# EAGLE design encoder-tester (EAGLE 6.1)
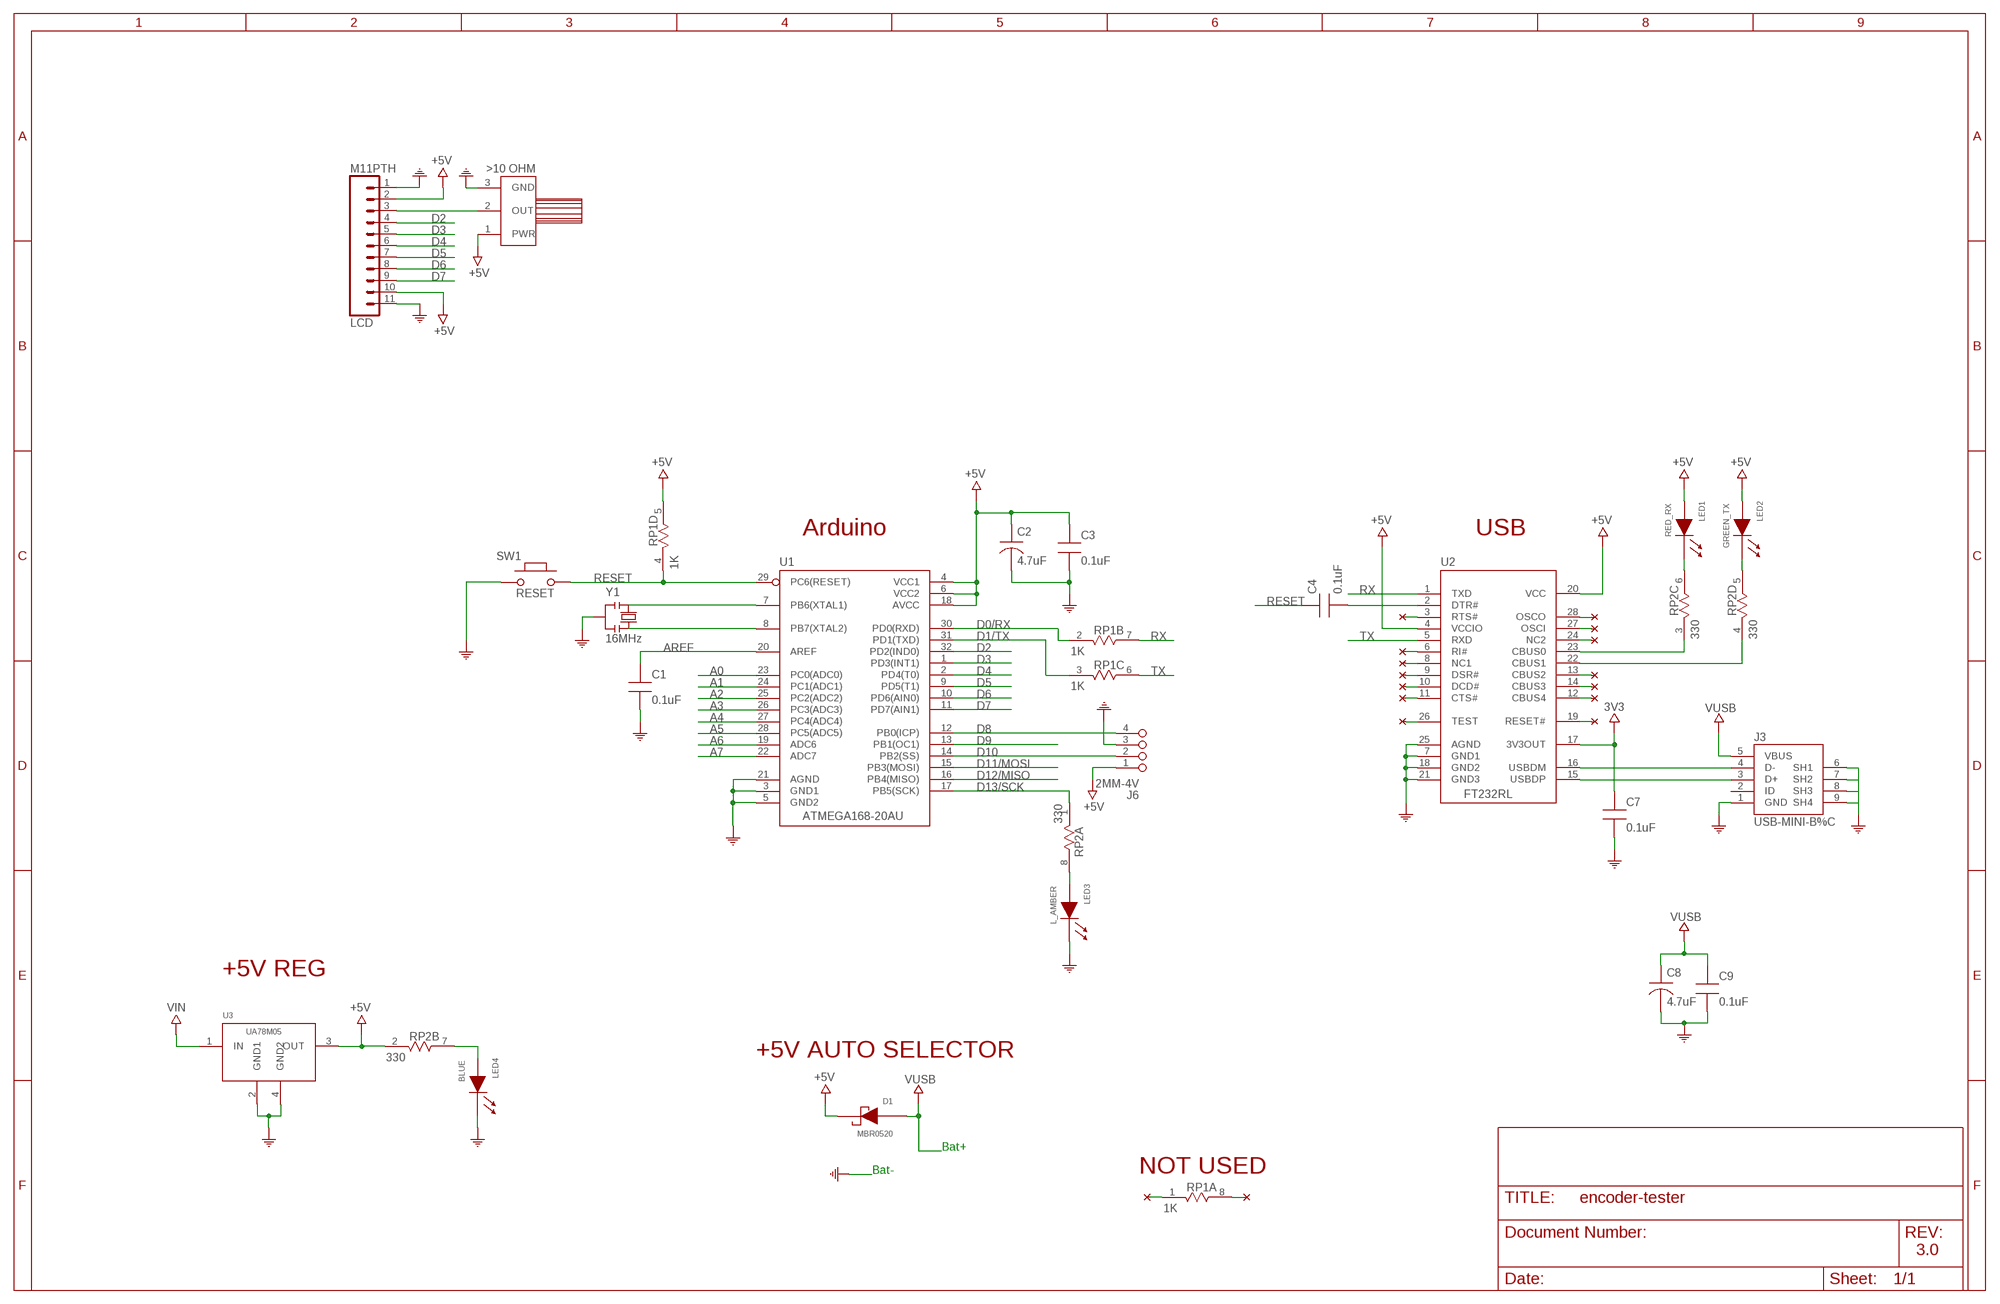
[diagram p0: schematic, sheet 1]

## Parts
C1  0.1uF  CAP0805-NP  [CAP0805-NP]
C2  4.7uF  CAP-TANA-P  [TAN-A]
C3  0.1uF  CAP0805-NP  [CAP0805-NP]
C4  0.1uF  CAP0805-NP  [CAP0805-NP]
C7  0.1uF  CAP0805-NP  [CAP0805-NP]
C8  4.7uF  CAP-TANA-P  [TAN-A]
C9  0.1uF  CAP0805-NP  [CAP0805-NP]
D1  MBR0520  [SOD-123]
J3  USB-MINI-B%C  [USB-MINI-B_2]
J6  2MM-4V  [2MM-4-V]
LCD  M11PTH  [1X11]
LED1  RED_RX  LED0805  [LED0805]
LED2  GREEN_TX  LED0805  [LED0805]
LED3  L_AMBER  LED0805  [LED0805]
LED4  BLUE  LED0805  [LED0805]
RP1  1K  RES4NT  [RES4NT]
RP2  330  RES4NT  [RES4NT]
SW1  RESET  PB157  [157SW]
U1  ATMEGA168-20AU  [QFP032]
U2  FT232RL  [SSOP28]
U3  UA78M05  [SOT223]
U$7  10OHMPOT  [POTFOOT]
Y1  16MHz  RESONATORMU  [RESONATOR]

## Nets
3V3: C7.1 U2.17(3V3OUT)
+5V: C2.1 C3.1 D1.1(CA) J6.1 LCD.2 LCD.10 LED1.2(AN) LED2.2(AN) RP1.5 RP2.2 U1.4(VCC1) U1.6(VCC2) U1.18(AVCC) U2.4(VCCIO) U2.20(VCC) U3.3(OUT) U$7.1(PWR)
A0: U1.23(PC0(ADC0))
A1: U1.24(PC1(ADC1))
A2: U1.25(PC2(ADC2))
A3: U1.26(PC3(ADC3))
A4: U1.27(PC4(ADC4))
A5: U1.28(PC5(ADC5))
A6: U1.19(ADC6)
A7: U1.22(ADC7)
AREF: C1.1 U1.20(AREF)
COM: C1.2 C2.2 C3.2 C7.2 C8.2 C9.2 J3.1(GND) J3.6(SH1) J3.7(SH2) J3.8(SH3) J3.9(SH4) J6.3 LCD.1 LCD.11 LED3.1(CA) LED4.1(CA) SW1.1 U1.3(GND1) U1.5(GND2) U1.21(AGND) U2.7(GND1) U2.18(GND2) U2.21(GND3) U2.25(AGND) U3.2(GND1) U3.4(GND2) U$7.3(GND) Y1.2
D0/RX: RP1.2 U1.30(PD0(RXD))
D1/TX: RP1.3 U1.31(PD1(TXD))
D2: LCD.4 U1.32(PD2(IND0))
D3: LCD.5 U1.1(PD3(INT1))
D4: LCD.6 U1.2(PD4(T0))
D5: LCD.7 U1.9(PD5(T1))
D6: LCD.8 U1.10(PD6(AIN0))
D7: LCD.9 U1.11(PD7(AIN1))
D8: J6.4 U1.12(PB0(ICP))
D9: U1.13(PB1(OC1))
D10: J6.2 U1.14(PB2(SS))
D11/MOSI: U1.15(PB3(MOSI))
D12/MISO: U1.16(PB4(MISO))
D13/SCK: RP2.1 U1.17(PB5(SCK))
N$1: U1.8(PB7(XTAL2)) Y1.3
N$2: U1.7(PB6(XTAL1)) Y1.1
N$3: LED4.2(AN) RP2.7
N$4: C4.2 U2.2(DTR#)
N$5: J3.3(D+) U2.15(USBDP)
N$6: J3.4(D-) U2.16(USBDM)
N$7: LED3.2(AN) RP2.8
N$8: RP2.3 U2.23(CBUS0)
N$9: RP2.4 U2.22(CBUS1)
N$10: LED1.1(CA) RP2.6
N$11: LED2.1(CA) RP2.5
N$12: U2.11(CTS#)
N$13: U2.6(RI#)
N$14: U2.8(NC1)
N$15: U2.9(DSR#)
N$16: U2.10(DCD#)
N$17: U2.28(OSCO)
N$18: U2.27(OSCI)
N$19: U2.24(NC2)
N$20: U2.13(CBUS2)
N$21: U2.14(CBUS3)
N$22: U2.12(CBUS4)
N$23: U2.19(RESET#)
N$24: RP1.1
N$25: RP1.8
N$26: U2.26(TEST)
N$27: U2.3(RTS#)
POT: LCD.3 U$7.2(OUT)
RESET: C4.1 RP1.4 SW1.2 U1.29(PC6(RESET))
RX: RP1.7 U2.1(TXD)
TX: RP1.6 U2.5(RXD)
VIN: U3.1(IN)
VUSB: C8.1 C9.1 D1.2(AN) J3.5(VBUS)
Unconnected: J3.2(ID)

## Notes on the sheet
- Arduino | USB
- +5V REG
- +5V AUTO SELECTOR
- Bat+
- Bat- | NOT USED
- 3.0

## Library data of the parts
C1 C3 C4 C7 C9 = MySMD:CAP0805-NP
C2 C8 = MySMD:CAP-TANA-P
D1 = MySMD:MBR0520
J3 = MyCON2:USB-MINI-B
J6 = 2mm:2MM-4
LCD = SparkFunEagle-6-6-07:M11: Header 11 Standard 11-pin 0.1" header. Use with straight break away headers (SKU : PRT-00116), right angle break away headers (PRT-00553), swiss pins (PRT-00743), machine pins (PRT-00117), and female headers (PRT-00115).
LED1-LED4 = MySMD:LED0805
RP1 RP2 = MySMD:RES4NT
SW1 = MySMD:PB157
U1 = MySMD:ATMEGA168-20AU
U2 = MySMD2:FT232RL
U3 = MySMD:UA78M05
U$7 = POT 10K OHM 9MM HORZ NO BUSHING:10OHMPOT
Y1 = MySMD2:RESONATOR

## Board
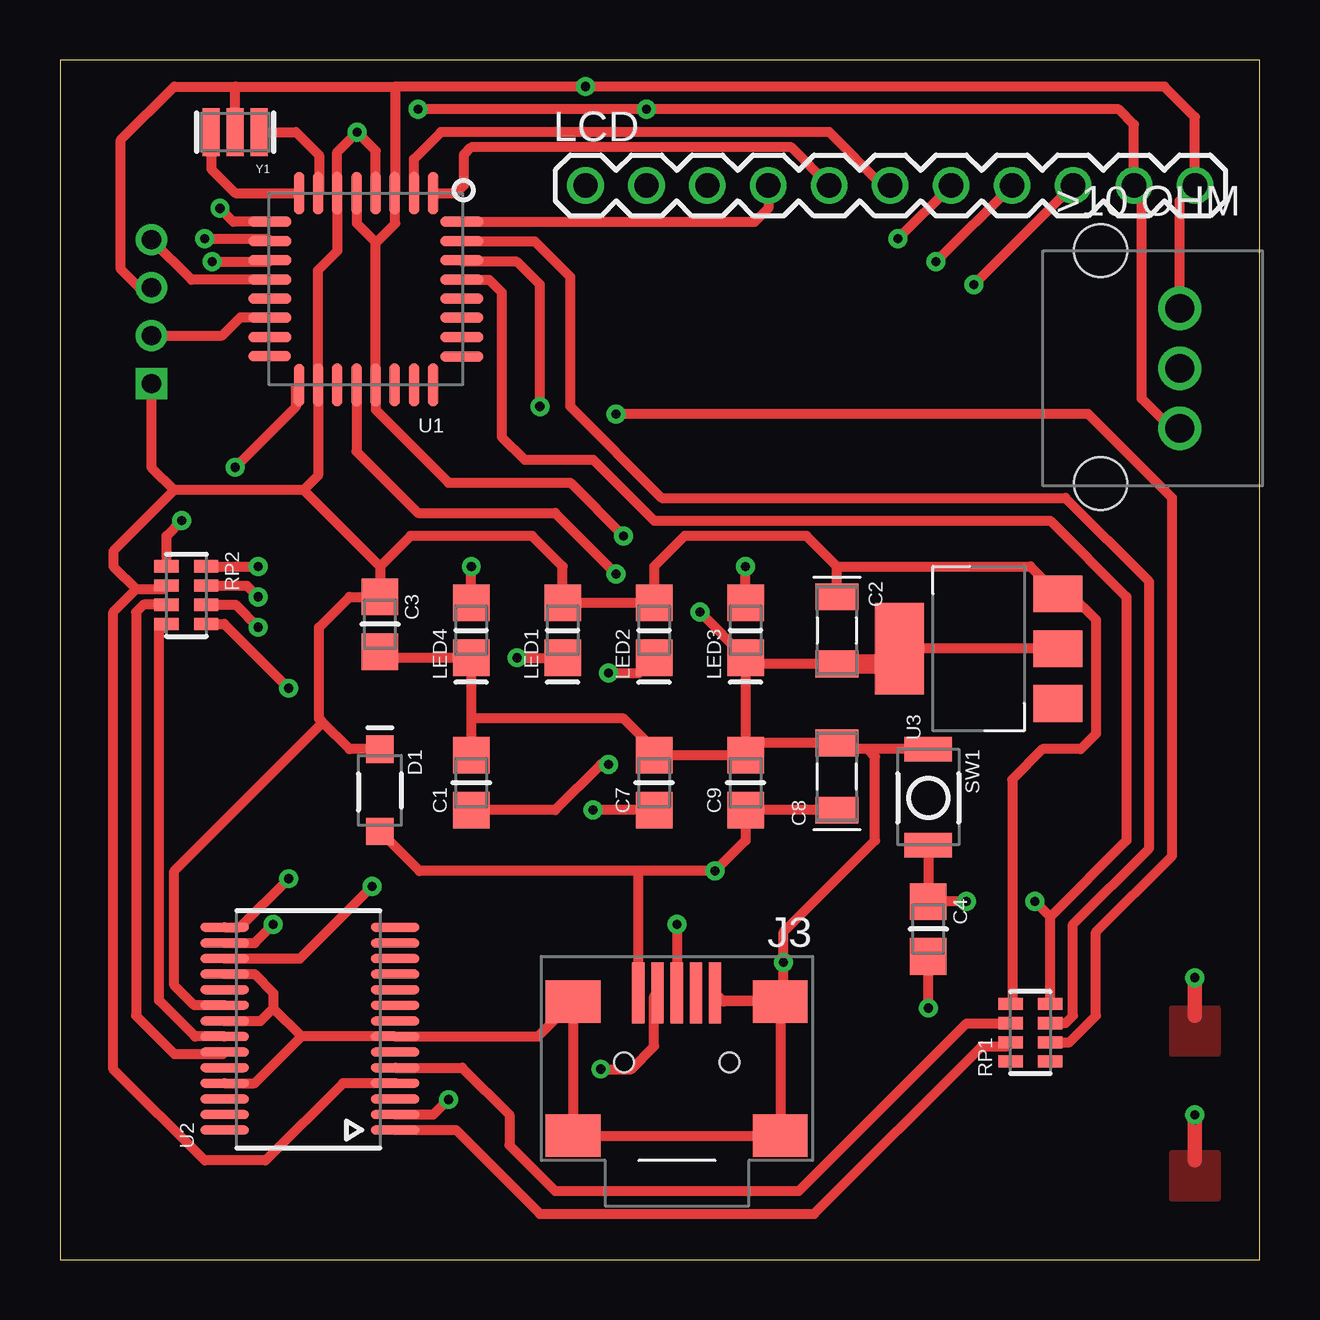
[diagram p1: board, top side]
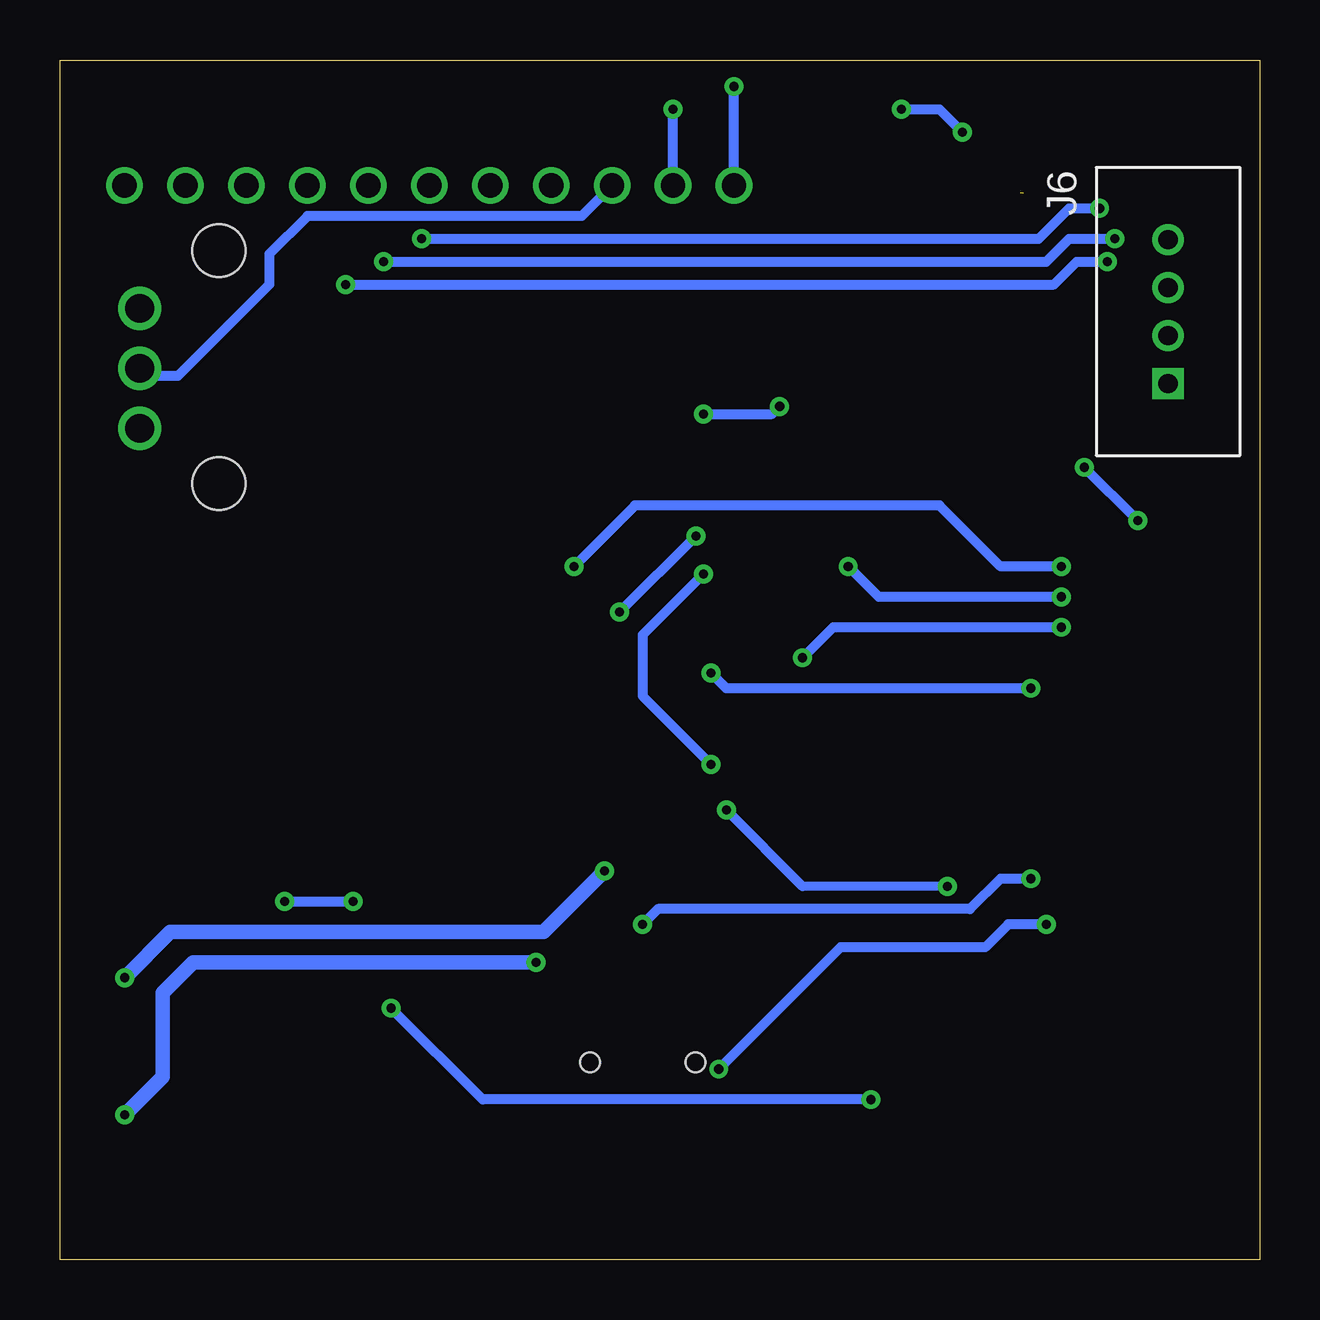
[diagram p2: board, bottom side, seen from below]

Size 50 x 50 mm. Coordinates in mm from the lower left corner, seen from the top.
Outline: 0,0 50,0 50,50 0,50 0,0
Copper layers (1*16): Top 0.0356mm / dielectric 63mil / Bottom 0.0356mm
Design rules "default": minimum track width 6mil, minimum drill 15mil, track to track 6mil, track to pad 6mil, pad to pad 6mil, via to via 6mil, smd to smd 6mil, copper to edge 0mil, drill to drill 6mil, minimum pad ring 10mil, minimum via ring 8mil, stop-mask expansion 4mil, vias tented up to drill 0mil, thermal gap 10mil

### Footprints (pad centres in the part's own frame; a part is rotated, then mirrored left to right if it is on the bottom)
CAP0805-NP = smd 1.524 x 1.524: 1 0,0; 2 2.286,0
TAN-A = smd 1.118 x 1.778: 1 0,0; 2 2.794,0
SOD-123 = smd 1.143 x 1.143: 1 0,0; 2 3.429,0
USB-MINI-B_2 = smd 0.508 x 2.54: 1 0,0; 2 0.8,0; 3 1.6,0; 4 2.4,0; 5 3.2,0 | smd 2.286 x 1.778: 6 -2.717,5.948; 7 -2.717,0.36; 8 5.918,0.36; 9 5.918,5.948 | hole 0.813: -0.6,2.9; 3.8,2.9
2MM-4-V = drill 0.8 square: 1 0,0 | drill 0.8: 2 -2,0; 3 -4,0; 4 -6,0
1X11 = drill 1.016: 1 0,0; 2 2.54,0; 3 5.08,0; 4 7.62,0; 5 10.16,0; 6 12.7,0; 7 15.24,0; 8 17.78,0; 9 20.32,0; 10 22.86,0; 11 25.4,0
LED0805 = smd 1.524 x 1.524: 1 0,0; 2 2.286,0
RES4NT = smd 0.508 x 1.016: 1 0,0; 2 0.8,0; 3 1.6,0; 4 2.4,0; 5 2.4,1.651; 6 1.6,1.651; 7 0.8,1.651; 8 0,1.651
157SW = smd 1.016 x 1.981: 1 0,0; 2 4,0
QFP032 = smd 0.432 x 1.778: 1 0,0; 2 0.8,0; 3 1.599,0; 4 2.399,0; 5 3.199,0; 6 3.998,0; 7 4.798,0; 8 5.598,0; 17 5.588,8.001; 18 4.798,7.997; 19 3.998,7.997; 20 3.199,7.997; 21 2.399,7.997; 22 1.599,7.997; 23 0.799,7.997; 24 0,7.997 | smd 1.778 x 0.432: 9 6.807,1.194; 10 6.807,2.007; 11 6.807,2.794; 12 6.807,3.607; 13 6.807,4.394; 14 6.807,5.182; 15 6.807,5.994; 16 6.816,6.803; 25 -1.194,6.807; 26 -1.194,5.994; 27 -1.194,5.182; 28 -1.194,4.394; 29 -1.194,3.607; 30 -1.194,2.794; 31 -1.194,2.007; 32 -1.194,1.194
SSOP28 = smd 0.381 x 2.032: 1 0,0; 2 0.65,0; 3 1.3,0; 4 1.95,0; 5 2.6,0; 6 3.25,0; 7 3.9,0; 8 4.55,0; 9 5.2,0; 10 5.85,0; 11 6.5,0; 12 7.15,0; 13 7.8,0; 14 8.45,0; 15 8.45,7.112; 16 7.8,7.112; 17 7.15,7.112; 18 6.5,7.112; 19 5.85,7.112; 20 5.2,7.112; 21 4.55,7.112; 22 3.9,7.112; 23 3.25,7.112; 24 2.6,7.112; 25 1.95,7.112; 26 1.3,7.112; 27 0.65,7.112; 28 0,7.112
SOT223 = smd 1.524 x 2.032: 1 0,0; 2 2.286,0; 3 4.572,0 | smd 3.81 x 2.032: 4 2.286,6.604
POTFOOT = drill 1.2: 1 0,2.5; 2 0,0; 3 0,-2.5 | hole 2.2: 3.3,4.8; 3.3,-4.9
RESONATOR = smd 0.7 x 2: 1 -1,0; 2 0,0; 3 1,0

### Placement (x,y rotation side)
C1  17.14,18.73 90 top
C2  32.38,27.62 270 top
C3  13.34,27.62 270 top
C4  36.2,14.92 270 top
C7  24.77,18.73 90 top
C8  32.38,18.73 90 top
C9  28.57,18.73 90 top
D1  13.34,21.27 270 top
J3  27.3,11.11 180 top
J6  3.81,36.51 270 bottom
LCD  21.91,44.77 0 top
LED1  20.95,25.08 90 top
LED2  24.77,25.08 90 top
LED3  28.57,25.08 90 top
LED4  17.14,25.08 90 top
RP1  41.27,8.26 90 top
RP2  4.45,28.89 270 top
SW1  36.2,21.27 270 top
U1  15.56,44.45 180 top
U2  13.97,5.4 90 top
U3  41.59,23.18 90 top
U$7  46.67,37.15 180 top
Y1  7.3,46.99 180 top

### Tracks (layer width: path | path; a pad name or v marks a point on that pad's centre or on a via)
3V3  (via drill 0.38)
  Top 0.406: C7.1 v22.23,18.73 | U2.17 10.01,12.55 v13.02,15.56
  Bottom 0.381: v13.02,15.56 19.05,15.56
  Bottom 0.406: 19.05,15.56 v22.23,18.73
+5V  (via drill 0.38)
  Top 0.406: C2.1 32.38,28.89 | 32.38,28.89 31.11,30.16 26.04,30.16 24.77,28.89 LED2.2 LED1.2 20.95,28.89 19.68,30.16 14.61,30.16 13.34,28.89 | 13.34,28.89 C3.1 12.06,27.62 10.79,26.35 10.79,22.54 10.95,22.38 | D1.1 12.06,21.27 10.95,22.38 | U2.20 5.59,10.6 4.76,11.43 4.76,16.19 10.95,22.38 | U2.4 11.79,7.35 8.57,4.13 6.03,4.13 2.22,7.94 2.22,26.99 3.17,27.94 | 3.17,27.94 4.29,27.94 RP2.2 | 13.34,28.89 10.16,32.07 | 10.16,32.07 4.76,32.07 | 4.76,32.07 2.22,29.53 2.22,28.89 3.17,27.94 | J6.1 3.81,33.02 4.76,32.07 | 10.16,32.07 10.76,32.67 U1.18 10.76,41.24 11.56,42.04 U1.6 11.56,46.17 v12.38,46.99 13.16,46.21 U1.4 | v14.92,47.94 v24.45,47.94 44.13,47.94 44.77,47.31 LCD.10 45.09,44.45 45.09,35.88 46.31,34.65 U$7.1 | 32.38,28.89 40.45,28.89 U3.3 42.1,27.75 43.18,26.67 43.18,21.91 42.55,21.27 40.96,21.27 39.69,20 39.69,10.72 RP1.5
  Bottom 0.406: LCD.2 v24.45,47.94 | v14.92,47.94 13.34,47.94 v12.38,46.99
AREF  (via drill 0.38)
  Top 0.406: U1.20 12.36,33.68 14.92,31.11 20.64,31.11 v23.18,28.57 | v22.86,20.64 22.54,20.64 20.64,18.73 C1.1
  Bottom 0.406: v23.18,28.57 25.72,26.04 25.72,23.5 v22.86,20.64
COM  (via drill 0.38)
  Top 0.406: 28.57,21.53 C8.2 32.64,21.27 33.66,21.27 | C2.2 28.57,24.83 LED3.1 | LED3.1 28.57,21.53 | 28.57,21.53 C9.2 C7.2 24.77,21.27 23.5,22.54 17.14,22.54 | 17.14,22.54 LED4.1 13.59,25.08 C3.2 | 17.14,22.54 C1.2 | U3.2 U3.4 | SW1.1 33.66,21.27 | 27.62,10.79 27.66,10.75 J3.7 J3.6 J3.9 J3.8 19.93,9.3 U2.7 10.07,9.3 | U2.18 8.11,11.9 8.89,11.11 8.89,10.48 | U2.21 8.36,9.95 8.89,10.48 | 10.07,9.3 8.89,10.48 | U2.25 8.12,7.35 10.07,9.3 | J3.1 27.62,10.79 | 27.62,10.79 30.16,10.79 v30.16,12.38 30.16,13.65 33.97,17.46 33.97,20.95 33.66,21.27 | U1.21 13.16,42.4 12.38,43.18 12.38,44.43 U1.5 | U1.21 13.16,42.37 13.97,43.18 13.97,44.44 U1.3 13.97,44.46 13.97,48.9 | Y1.2 7.3,48.9 | U1.21 13.16,35.42 16.19,32.38 21.27,32.38 v23.5,30.16 | v26.67,26.99 LED3.1 | J6.3 3.3,40.51 2.54,41.27 2.54,46.67 4.76,48.9 7.3,48.9 | 7.3,48.9 13.97,48.9 | 13.97,48.9 v21.91,48.9 46.04,48.9 47.31,47.62 LCD.11 46.67,44.13 U$7.3
  Top 0.61: v47.31,6.03 47.31,4.13
  Top 0.813: C2.2 34.35,24.83 U3.4
  Bottom 0.406: v23.5,30.16 v26.67,26.99 | LCD.1 v21.91,48.9
  Bottom 0.61: v30.16,12.38 44.45,12.38 45.72,11.11 45.72,7.62 v47.31,6.03
  pour Top: 46.35,4.45 48.26,4.45 48.26,2.86 48.26,2.54 46.35,2.54
D0/RX  (via drill 0.38)
  Top 0.406: RP1.2 42.08,9.05 43.18,10.16 43.18,13.65 46.35,16.83 46.35,31.75 42.86,35.24 v23.18,35.24 | v20,35.56 20,40.64 19.05,41.59 16.82,41.59 U1.30
  Bottom 0.406: v23.18,35.24 20.32,35.24 v20,35.56
D1/TX
  Top 0.406: RP1.3 41.92,9.86 42.23,10.16 42.23,13.97 45.4,17.14 45.4,28.26 41.91,31.75 25.08,31.75 21.27,35.56 21.27,40.96 19.79,42.44 U1.31
D2
  Top 0.406: U1.32 28.97,43.26 29.53,43.81 LCD.4
D3
  Top 0.406: LCD.5 30.48,46.35 17.14,46.35 16.83,46.04 16.83,44.77 16.51,44.45 U1.1
D4
  Top 0.406: LCD.6 34.29,44.77 32.07,46.99 15.88,46.99 14.76,45.87 U1.2
D5  (via drill 0.38)
  Top 0.406: LCD.7 v34.92,42.55 | U1.9 7.23,43.26 v6.67,43.81
  Bottom 0.406: v34.92,42.55 9.21,42.55 7.94,43.81 v6.67,43.81
D6  (via drill 0.38)
  Top 0.406: LCD.8 v36.51,41.59 | v6.03,42.55 8.65,42.55 U1.10
  Bottom 0.406: v36.51,41.59 8.89,41.59 7.94,42.55 v6.03,42.55
D7  (via drill 0.38)
  Top 0.406: LCD.9 v38.1,40.64 | v6.35,41.59 8.69,41.59 U1.11
  Bottom 0.406: v38.1,40.64 8.57,40.64 7.62,41.59 v6.35,41.59
D8
  Top 0.406: U1.12 5.48,40.84 J6.4
D10
  Top 0.406: J6.2 6.76,38.51 7.52,39.27 U1.14
D13/SCK  (via drill 0.38)
  Top 0.406: RP2.1 4.45,30.16 v5.08,30.8 | v7.3,33.02 9.84,35.56 9.84,36.32 U1.17
  Bottom 0.406: v5.08,30.8 v7.3,33.02
N$1  (1 unrouted)
  Top 0.406: Y1.3 6.3,45.45 7.3,44.45 9.84,44.45
N$2
  Top 0.406: Y1.1 9.84,46.99 10.79,46.04 10.79,44.49 U1.7
N$3  (via drill 0.38)
  Top 0.406: LED4.2 v17.14,28.89 | RP2.7 7.79,28.09 v8.26,27.62
  Bottom 0.406: v8.26,27.62 15.88,27.62 v17.14,28.89
N$4  (via drill 0.38)
  Top 0.406: U2.2 15.57,6.05 v16.19,6.67 | v36.2,10.48 C4.2
  Bottom 0.406: v16.19,6.67 32.38,6.67 v36.2,10.48
N$5  (via drill 0.38)
  Top 0.406: U2.15 7.5,13.85 v9.53,15.88 | v25.72,13.97 25.72,11.12 J3.3
  Bottom 0.406: v9.53,15.88 10.79,15.88 12.06,14.61 25.08,14.61 v25.72,13.97
N$6  (via drill 0.38)
  Top 0.406: U2.16 8.12,13.2 v8.89,13.97 | v22.54,7.94 23.81,7.94 24.77,8.89 24.77,10.97 J3.4
  Bottom 0.406: v8.89,13.97 10.48,13.97 11.43,13.02 17.46,13.02 v22.54,7.94
N$7  (via drill 0.38)
  Top 0.406: LED3.2 v28.57,28.89 | RP2.8 v8.26,28.89
  Bottom 0.406: v8.26,28.89 10.79,28.89 13.34,31.43 26.04,31.43 v28.57,28.89
N$8
  Top 0.406: RP2.3 3.48,27.29 3.17,26.99 3.17,10.16 4.76,8.57 6.78,8.57 U2.23
N$9
  Top 0.406: U2.22 5.62,9.3 4.13,10.79 4.13,26.18 RP2.4
N$10  (via drill 0.38)
  Top 0.406: RP2.6 7.32,27.29 v8.26,26.35 | v19.05,25.08 LED1.1
  Bottom 0.406: v8.26,26.35 17.78,26.35 v19.05,25.08
N$11  (via drill 0.38)
  Top 0.406: RP2.5 6.84,26.49 v9.53,23.81 | v22.86,24.45 24.13,24.45 LED2.1
  Bottom 0.406: v9.53,23.81 22.23,23.81 v22.86,24.45
POT
  Bottom 0.406: LCD.3 28.26,43.5 39.69,43.5 41.27,41.91 41.27,40.64 45.09,36.83 46.35,36.83 U$7.2
RESET  (via drill 0.38)
  Top 0.406: SW1.2 C4.1 v37.78,14.92 | RP1.4 41.27,14.29 | 41.27,14.29 v40.64,14.92 | U1.29 17.89,40.84 18.41,40.32 18.41,34.29 19.37,33.34 22.23,33.34 24.77,30.8 41.27,30.8 44.45,27.62 44.45,17.46 41.27,14.29
  Bottom 0.406: v40.64,14.92 v37.78,14.92
RX
  Top 0.406: U2.1 16.51,5.4 20,1.91 31.43,1.91 38.42,8.89 39.46,8.89 RP1.7
TX
  Top 0.406: U2.5 16.77,8 18.73,6.03 18.73,4.76 20.64,2.86 30.8,2.86 37.78,9.84 39.61,9.84 RP1.6
VUSB  (via drill 0.38)
  Top 0.406: C8.1 C9.1 28.57,17.46 v27.3,16.19 24.11,16.19 | 24.11,16.19 14.99,16.19 D1.2 | J3.5 24.11,16.19
  Top 0.61: v47.31,11.75 47.31,10.16
  Bottom 0.61: v27.3,16.19 29.84,13.65 45.4,13.65 v47.31,11.75
  pour Top: 46.35,10.48 48.26,10.48 48.26,8.57 46.35,8.57